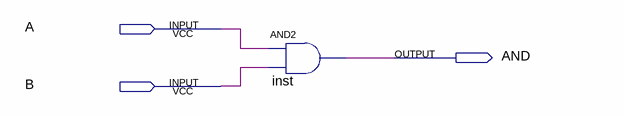
[diagram p0: schematic sheet]
// Quartus schematic portaAND.bdf as structural Verilog: 1 symbols, 3 pins
module portaAND (
  input  A,
  input  B,
  output AND
);

  and inst (AND, A, B);
endmodule
